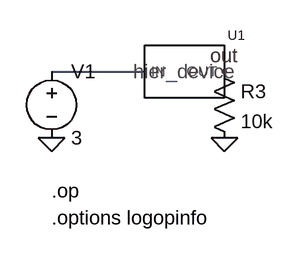
[diagram p0: schematic hier_device_logopinfo.asc]
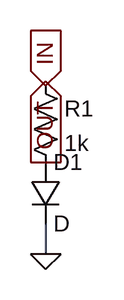
[diagram p1: sub-circuit hier_device.asc]
hier_device_logopinfo.asc, the LTspice schematic file:
Version 4
SHEET 1 880 680
WIRE 0 16 112 16
FLAG 0 96 0
FLAG 208 16 out
FLAG 208 96 0
SYMBOL voltage 0 0 R0
SYMATTR InstName V1
SYMATTR Value 3
SYMBOL hier_device 160 16 R0
SYMATTR InstName U1
SYMBOL res 192 0 R0
SYMATTR InstName R3
SYMATTR Value 10k
TEXT 0 160 Left 2 !.op
TEXT 0 192 Left 2 !.options logopinfo

hier_device.asc, the sub-circuit schematic file:
Version 4
SHEET 1 880 680
WIRE 0 160 0 192
FLAG 0 16 IN
IOPIN 0 16 In
FLAG 0 96 OUT
IOPIN 0 96 Out
FLAG 0 192 0
SYMBOL res -16 0 R0
SYMATTR InstName R1
SYMATTR Value 1k
SYMBOL diode -16 96 R0
SYMATTR InstName D1
SYMATTR Value D

The netlist it stands for:
* hier_device_logopinfo.asc
V1 N001 0 3
XU1 N001 out hier_device
R3 out 0 10k

* block symbol definitions
.subckt hier_device IN OUT
R1 IN OUT 1k
D1 OUT 0 D
.ends hier_device

.model D D
.lib standard.dio
.op
.options logopinfo
.backanno
.end